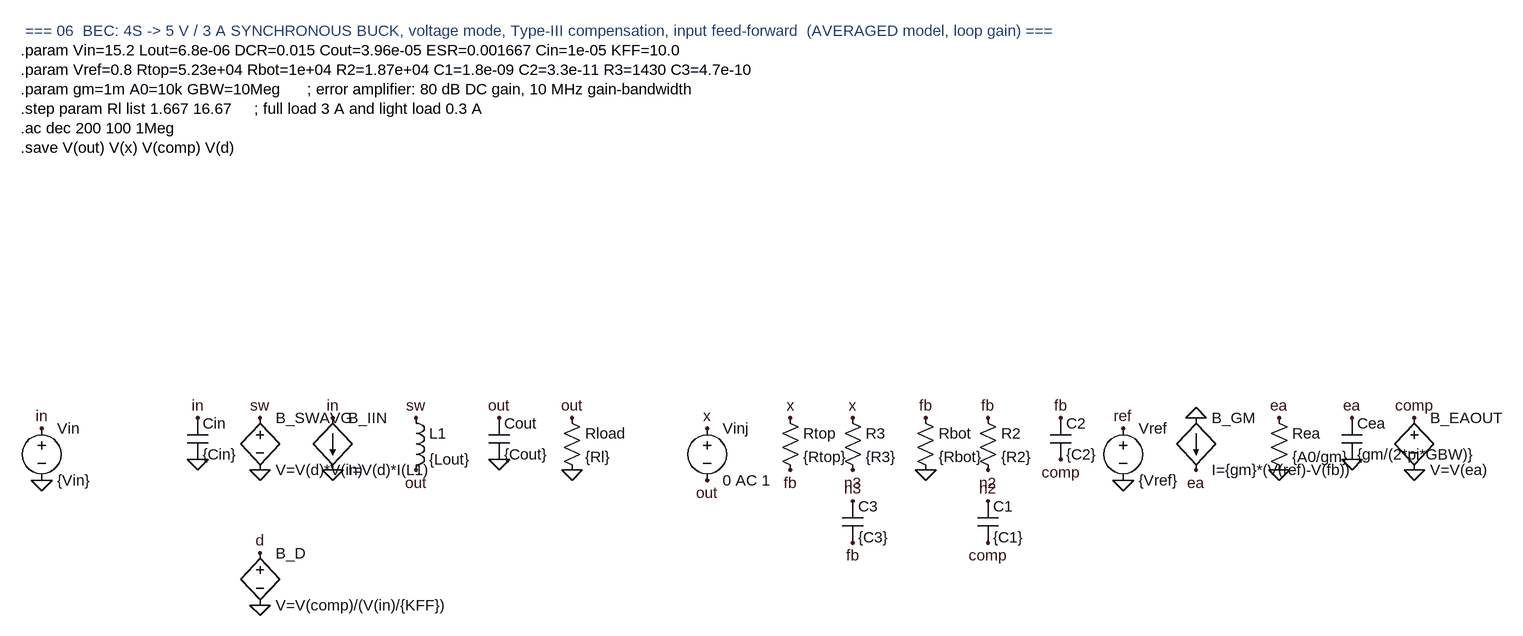
[diagram p0: schematic BEC_Buck_AC.asc]
BEC_Buck_AC.asc, the LTspice schematic file:
Version 4
SHEET 1 2400 1400
SYMBOL voltage 64 96 R0
SYMATTR InstName Vin
SYMATTR Value {Vin}
FLAG 64 112 in
FLAG 64 192 0
SYMBOL cap 288 96 R0
SYMATTR InstName Cin
SYMATTR Value {Cin}
SYMATTR SpiceLine Rser=3m Lser=0.5n
FLAG 304 96 in
FLAG 304 160 0
SYMBOL bv 400 80 R0
SYMATTR InstName B_SWAVG
SYMATTR Value V=V(d)*V(in)
FLAG 400 96 sw
FLAG 400 176 0
SYMBOL bi 512 96 R0
SYMATTR InstName B_IIN
SYMATTR Value I=V(d)*I(L1)
FLAG 512 96 in
FLAG 512 176 0
SYMBOL bv 400 288 R0
SYMATTR InstName B_D
SYMATTR Value V=V(comp)/(V(in)/{KFF})
FLAG 400 304 d
FLAG 400 384 0
SYMBOL ind 624 80 R0
SYMATTR InstName L1
SYMATTR Value {Lout}
SYMATTR SpiceLine Rser={DCR}
FLAG 640 96 sw
FLAG 640 176 out
SYMBOL cap 752 96 R0
SYMATTR InstName Cout
SYMATTR Value {Cout}
SYMATTR SpiceLine Rser={ESR} Lser=0.3n
FLAG 768 96 out
FLAG 768 160 0
SYMBOL res 864 80 R0
SYMATTR InstName Rload
SYMATTR Value {Rl}
FLAG 880 96 out
FLAG 880 176 0
SYMBOL voltage 1088 96 R0
SYMATTR InstName Vinj
SYMATTR Value 0 AC 1
FLAG 1088 112 x
FLAG 1088 192 out
SYMBOL res 1200 80 R0
SYMATTR InstName Rtop
SYMATTR Value {Rtop}
FLAG 1216 96 x
FLAG 1216 176 fb
SYMBOL res 1296 80 R0
SYMATTR InstName R3
SYMATTR Value {R3}
FLAG 1312 96 x
FLAG 1312 176 n3
SYMBOL cap 1296 224 R0
SYMATTR InstName C3
SYMATTR Value {C3}
FLAG 1312 224 n3
FLAG 1312 288 fb
SYMBOL res 1408 80 R0
SYMATTR InstName Rbot
SYMATTR Value {Rbot}
FLAG 1424 96 fb
FLAG 1424 176 0
SYMBOL res 1504 80 R0
SYMATTR InstName R2
SYMATTR Value {R2}
FLAG 1520 96 fb
FLAG 1520 176 n2
SYMBOL cap 1504 224 R0
SYMATTR InstName C1
SYMATTR Value {C1}
FLAG 1520 224 n2
FLAG 1520 288 comp
SYMBOL cap 1616 96 R0
SYMATTR InstName C2
SYMATTR Value {C2}
FLAG 1632 96 fb
FLAG 1632 160 comp
SYMBOL voltage 1728 96 R0
SYMATTR InstName Vref
SYMATTR Value {Vref}
FLAG 1728 112 ref
FLAG 1728 192 0
SYMBOL bi 1840 96 R0
SYMATTR InstName B_GM
SYMATTR Value I={gm}*(V(ref)-V(fb))
FLAG 1840 96 0
FLAG 1840 176 ea
SYMBOL res 1952 80 R0
SYMATTR InstName Rea
SYMATTR Value {A0/gm}
FLAG 1968 96 ea
FLAG 1968 176 0
SYMBOL cap 2064 96 R0
SYMATTR InstName Cea
SYMATTR Value {gm/(2*pi*GBW)}
FLAG 2080 96 ea
FLAG 2080 160 0
SYMBOL bv 2176 80 R0
SYMATTR InstName B_EAOUT
SYMATTR Value V=V(ea)
FLAG 2176 96 comp
FLAG 2176 176 0
TEXT 32 -500 Left 2 ; === 06  BEC: 4S -> 5 V / 3 A SYNCHRONOUS BUCK, voltage mode, Type-III compensation, input feed-forward  (AVERAGED model, loop gain) ===
TEXT 32 -470 Left 2 !.param Vin=15.2 Lout=6.8e-06 DCR=0.015 Cout=3.96e-05 ESR=0.001667 Cin=1e-05 KFF=10.0
TEXT 32 -440 Left 2 !.param Vref=0.8 Rtop=5.23e+04 Rbot=1e+04 R2=1.87e+04 C1=1.8e-09 C2=3.3e-11 R3=1430 C3=4.7e-10
TEXT 32 -410 Left 2 !.param gm=1m A0=10k GBW=10Meg      ; error amplifier: 80 dB DC gain, 10 MHz gain-bandwidth
TEXT 32 -380 Left 2 !.step param Rl list 1.667 16.67     ; full load 3 A and light load 0.3 A
TEXT 32 -350 Left 2 !.ac dec 200 100 1Meg
TEXT 32 -320 Left 2 !.save V(out) V(x) V(comp) V(d)

The netlist it stands for:
* BEC_Buck_AC.asc
Vin in 0 {Vin}
Cin in 0 {Cin} Rser=3m Lser=0.5n
B_SWAVG sw 0 V=V(d)*V(in)
B_IIN in 0 I=V(d)*I(L1)
B_D d 0 V=V(comp)/(V(in)/{KFF})
L1 sw out {Lout} Rser={DCR}
Cout out 0 {Cout} Rser={ESR} Lser=0.3n
Rload out 0 {Rl}
Vinj x out 0 AC 1
Rtop x fb {Rtop}
R3 x n3 {R3}
C3 n3 fb {C3}
Rbot fb 0 {Rbot}
R2 fb n2 {R2}
C1 n2 comp {C1}
C2 fb comp {C2}
Vref ref 0 {Vref}
B_GM 0 ea I={gm}*(V(ref)-V(fb))
Rea ea 0 {A0/gm}
Cea ea 0 {gm/(2*pi*GBW)}
B_EAOUT comp 0 V=V(ea)
*  === 06  BEC: 4S -> 5 V / 3 A SYNCHRONOUS BUCK, voltage mode, Type-III compensation, input feed-forward  (AVERAGED model, loop gain) ===
.param Vin=15.2 Lout=6.8e-06 DCR=0.015 Cout=3.96e-05 ESR=0.001667 Cin=1e-05 KFF=10.0
.param Vref=0.8 Rtop=5.23e+04 Rbot=1e+04 R2=1.87e+04 C1=1.8e-09 C2=3.3e-11 R3=1430 C3=4.7e-10
.param gm=1m A0=10k GBW=10Meg      ; error amplifier: 80 dB DC gain, 10 MHz gain-bandwidth
.step param Rl list 1.667 16.67     ; full load 3 A and light load 0.3 A
.ac dec 200 100 1Meg
.save V(out) V(x) V(comp) V(d)
.backanno
.end